# Altium schematic sheet AT25256A_1.SchDoc
size 420 x 297 mm; Organization: Protel International P/L; PageSetup: Record=PageOptions|CenterHorizontal=True|CenterVertical=True|PrintScale=0.70|XCorrection=1.00|YCorrection=1.00|PrintKind=2|BorderSize=5000000|LeftOffset=0|BottomOffset=0|Orientation=2|PaperLength=1000|PaperWidth=1000|Scale=100|PaperSource=7|PrintQuality=600|MediaType=1|DitherType=10|PaperKind=A4|PrintScaleMode=1; Razrabotal: Балобанов; Proveril: Шартдинов; NachKb: Рекалов; Nkontr: Завалина; Utv: Беккель; DecNum: ЦВИЯ.467239.035 Э3; Naim1: УУ; Naim2: Схема электрическая; Naim3: принципиальная; List: 1; Listov: 1; DecNum2: ЦВИЯ.467239.035 Э3
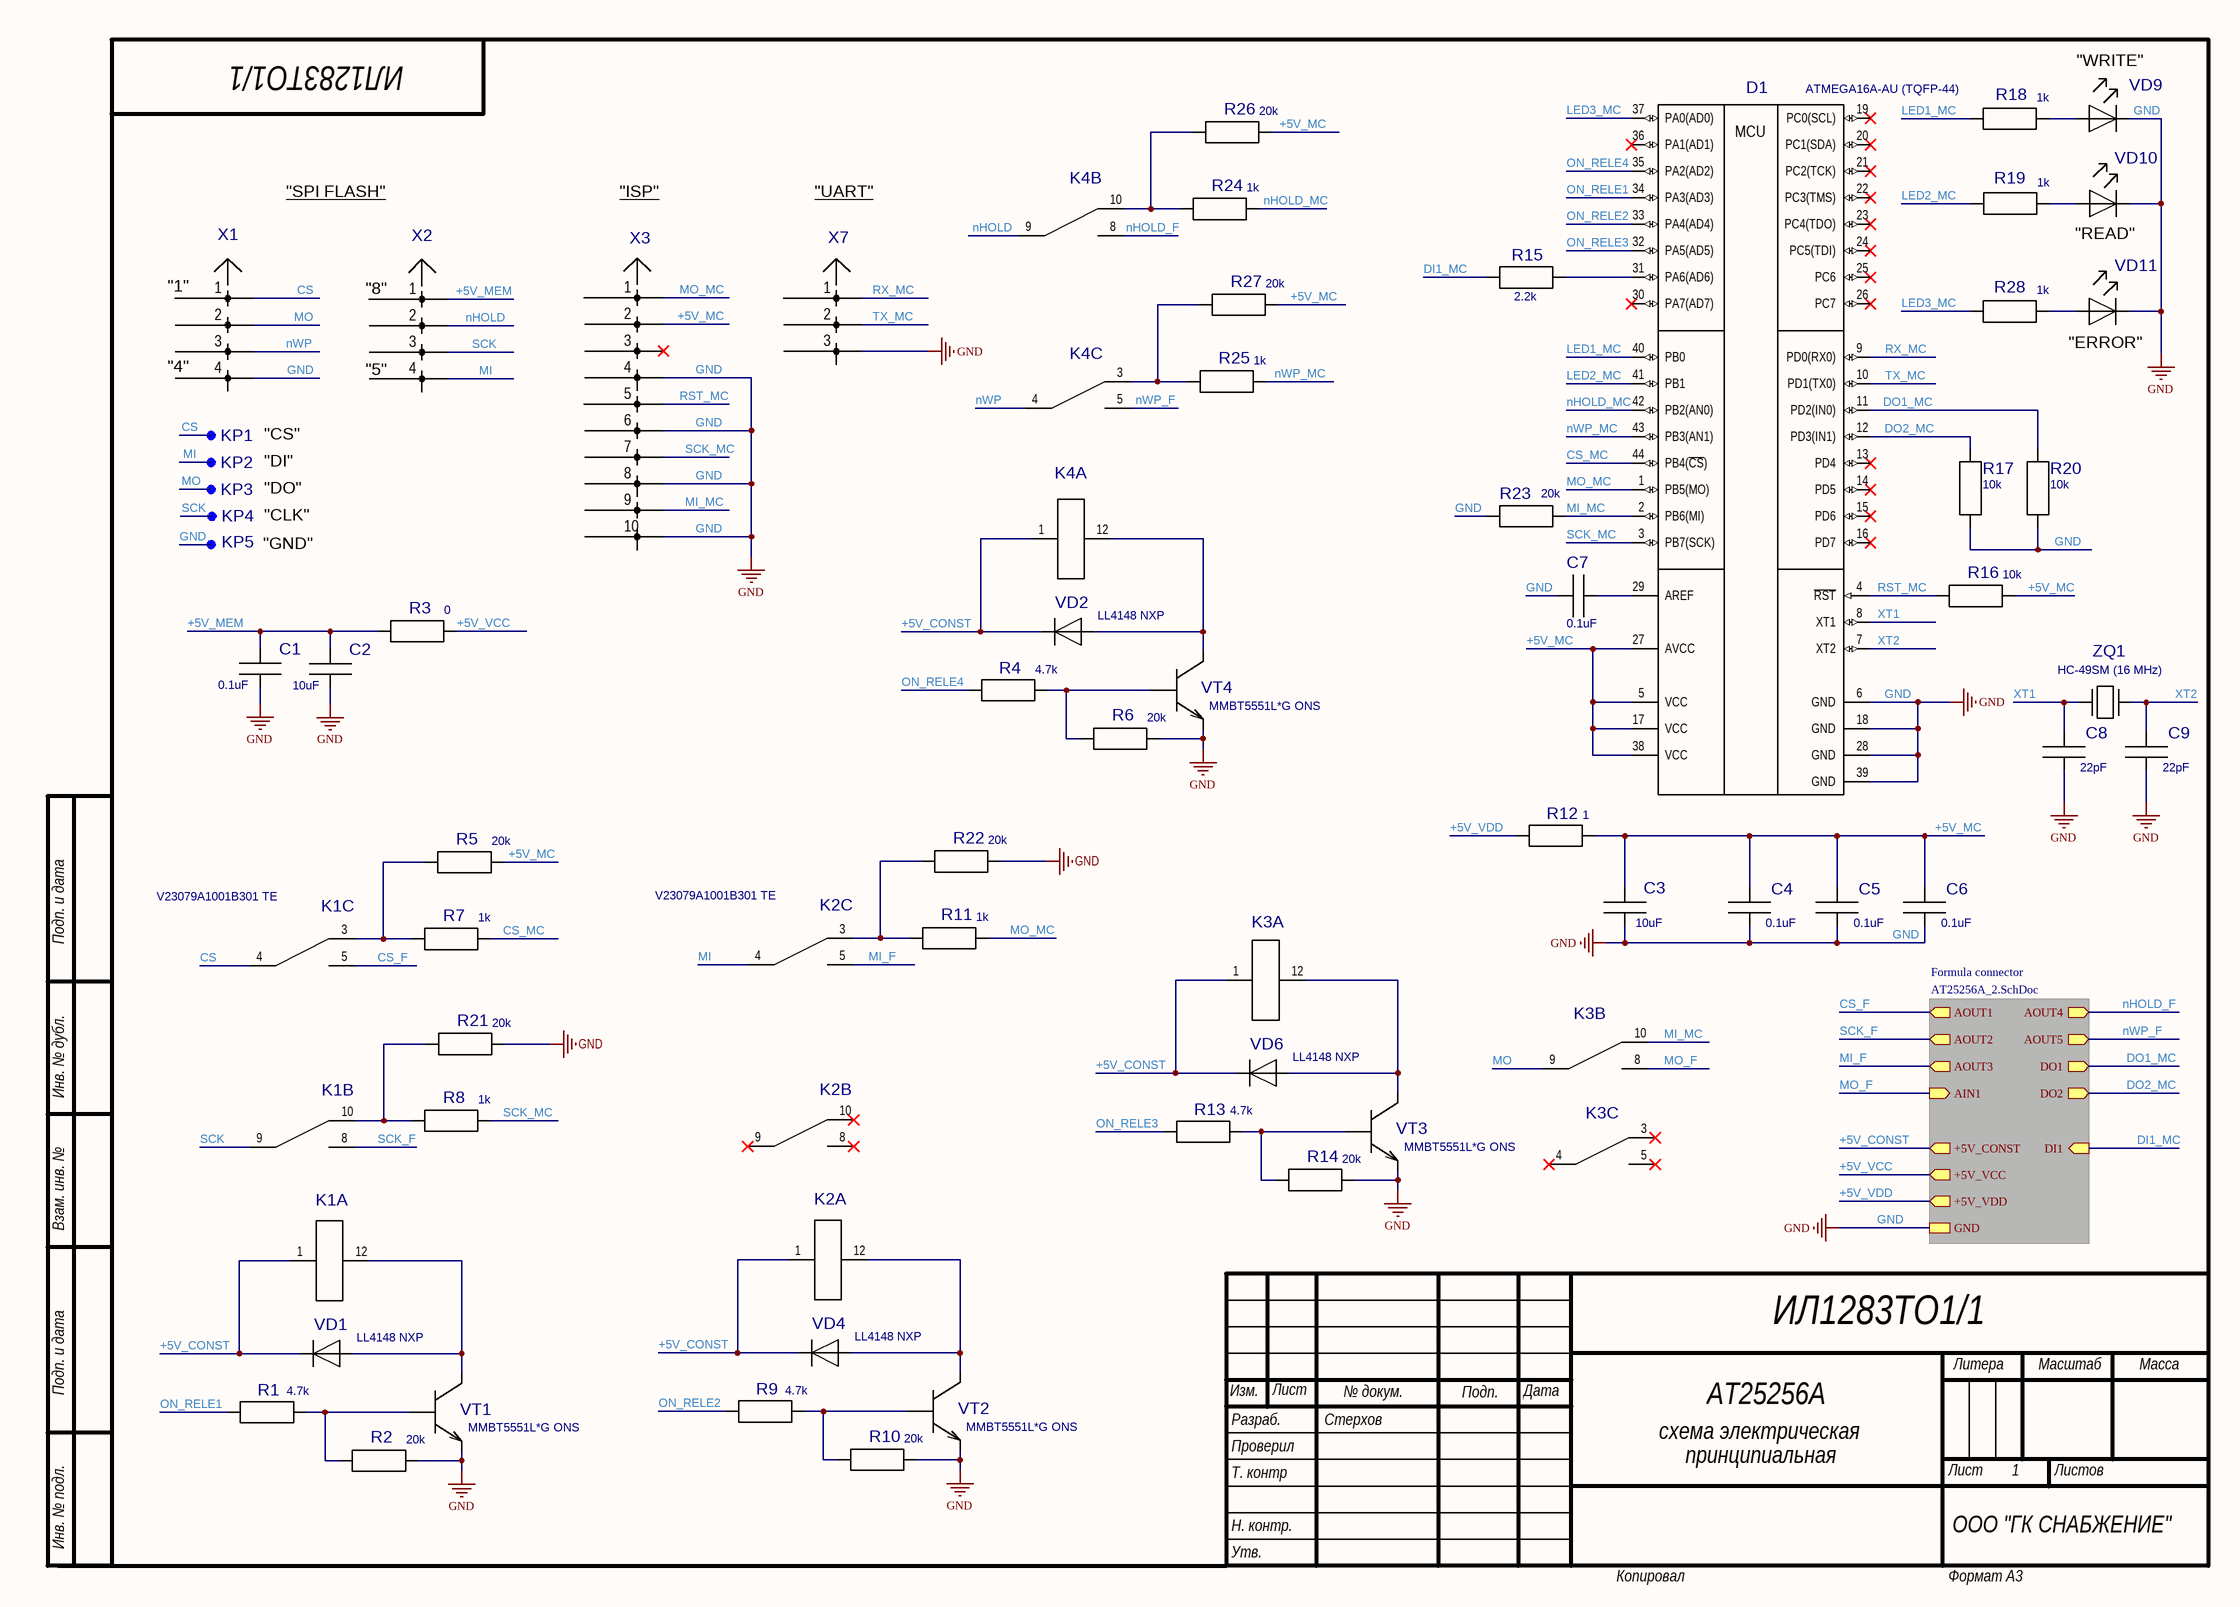
[diagram p0: AT25256A_1.SchDoc]

## Parts
C1  value 0.1uF  [0805 AVX]  (hidden comment: A612 (0805) AVX)
C2  value 10uF  [0805 AVX]  (hidden comment: A612 (0805) AVX)
C3  value 10uF  [0805 AVX]  (hidden comment: A612 (0805) AVX)
C4  value 0.1uF  [0805 AVX]  (hidden comment: A612 (0805) AVX)
C5  value 0.1uF  [0805 AVX]  (hidden comment: A612 (0805) AVX)
C6  value 0.1uF  [0805 AVX]  (hidden comment: A612 (0805) AVX)
C7  value 0.1uF  [0805 AVX]  (hidden comment: A612 (0805) AVX)
C8  value 22pF  [0805 AVX]  (hidden comment: A612 (0805) AVX)
C9  value 22pF  [0805 AVX]  (hidden comment: A612 (0805) AVX)
D1  ATMEGA16A-AU (TQFP-44)  [44-TQFP]
K1  V23079A1001B301 TE  [V23079A1001B301]  (value not drawn)  (parts A,B,C of 3)
K2  V23079A1001B301 TE  [V23079A1001B301]  (value not drawn)  (parts A,B,C of 3)
K3  V23079A1001B301 TE  [V23079A1001B301]  (value not drawn)  (parts A,B,C of 3)
K4  V23079A1001B301 TE  [V23079A1001B301]  (value not drawn)  (parts A,B,C of 3)
KP1  Contplosh2.5x0.8  [Plosh25x08]  (value not drawn)
KP2  Contplosh2.5x0.8  [Plosh25x08]  (value not drawn)
KP3  Contplosh2.5x0.8  [Plosh25x08]  (value not drawn)
KP4  Contplosh2.5x0.8  [Plosh25x08]  (value not drawn)
KP5  Contplosh2.5x0.8  [Plosh25x08]  (value not drawn)
R1  4.7k  [0805]
R2  20k  [0805]
R3  0  [0805]
R4  4.7k  [0805]
R5  20k  [0805]
R6  20k  [0805]
R7  1k  [0805]
R8  1k  [0805]
R9  4.7k  [0805]
R10  20k  [0805]
R11  1k  [0805]
R12  1  [0805]
R13  4.7k  [0805]
R14  20k  [0805]
R15  2.2k  [0805]
R16  10k  [0805]
R17  10k  [0805]
R18  1k  [0805]
R19  1k  [0805]
R20  10k  [0805]
R21  20k  [0805]
R22  20k  [0805]
R23  20k  [0805]
R24  1k  [0805]
R25  1k  [0805]
R26  20k  [0805]
R27  20k  [0805]
R28  1k  [0805]
VD1  LL4148 NXP  [SOD80C]
VD2  LL4148 NXP  [SOD80C]
VD4  LL4148 NXP  [SOD80C]
VD6  LL4148 NXP  [SOD80C]
VD9  LED(0805)  [0805]  (value not drawn)
VD10  LED(0805)  [0805]  (value not drawn)
VD11  LED(0805)  [0805]  (value not drawn)
VT1  MMBT5551L*G ONS  [SOT-23]
VT2  MMBT5551L*G ONS  [SOT-23]
VT3  MMBT5551L*G ONS  [SOT-23]
VT4  MMBT5551L*G ONS  [SOT-23]
X1  PLD4-2,54  [PLD4-2,54]  (value not drawn)
X2  PLD4-2,54  [PLD4-2,54]  (value not drawn)
X3  PLD10-2,54  [PLD10-2,54]  (value not drawn)
X7  PLD3-2,54  [PLD3-2,54]  (value not drawn)
ZQ1  HC-49SM (16 MHz)  [HC-49SM]

## Sub-sheets
Formula connector = AT25256A_2.SchDoc: DO1 (out), DO2 (out), DI1 (in), AOUT2 (out), +5V_VCC (out), +5V_VDD (out), GND, +5V_CONST (out), AOUT3 (out), AIN1 (in), AOUT1 (out), AOUT4 (out), AOUT5 (out)

## Nets
GND: C1.2 C2.2 C3.2 C4.2 C5.2 C6.2 C7.1 C8.2 C9.2 D1.6(GND) D1.18(GND) D1.28(GND) D1.39(GND) KP5.1 R2.2 R6.2 R10.2 R14.2 R17.1 R20.1 R21.2 R22.2 R23.1 VD9.2(K) VD10.2(K) VD11.2(K) VT1.2(E) VT2.2(E) VT3.2(E) VT4.2(E) X1.4 X3.4 X3.6 X3.8 X3.10 X7.3 ; sheet Formula connector/GND
+5V_CONST: K1.1(+) K2.1(+) K3.1(+) K4.1(+) VD1.2(K) VD2.2(K) VD4.2(K) VD6.2(K) ; sheet Formula connector/+5V_CONST
+5V_MC: C3.1 C4.1 C5.1 C6.1 D1.5(VCC) D1.17(VCC) D1.27(AVCC) D1.38(VCC) R5.2 R12.2 R16.2 R26.2 R27.2 X3.2
+5V_MEM: C1.1 C2.1 R3.1 X2.1
+5V_VCC: R3.2 ; sheet Formula connector/+5V_VCC
+5V_VDD: R12.1 ; sheet Formula connector/+5V_VDD
CS: K1.4(sw4) KP1.1 X1.1
CS_F: K1.5(sw6) ; sheet Formula connector/AOUT1
CS_MC: D1.44(PB4(~{CS})) R7.2
DI1_MC: R15.1 ; sheet Formula connector/DI1
DO1_MC: D1.11(PD2(IN0)) R20.2 ; sheet Formula connector/DO1
DO2_MC: D1.12(PD3(IN1)) R17.2 ; sheet Formula connector/DO2
LED1_MC: D1.40(PB0) R18.1
LED2_MC: D1.41(PB1) R19.1
LED3_MC: D1.37(PA0(AD0)) R28.1
MI: K2.4(sw4) KP2.1 X2.4
MI_F: K2.5(sw6) ; sheet Formula connector/AOUT3
MI_MC: D1.2(PB6(MI)) K3.10(sw2) R23.2 X3.9
MO: K3.9(sw1) KP3.1 X1.2
MO_F: K3.8(sw3) ; sheet Formula connector/AIN1
MO_MC: D1.1(PB5(MO)) R11.2 X3.1
nHOLD: K4.9(sw1) X2.2
nHOLD_F: K4.8(sw3) ; sheet Formula connector/AOUT4
nHOLD_MC: D1.42(PB2(AN0)) R24.2
nWP: K4.4(sw4) X1.3
nWP_F: K4.5(sw6) ; sheet Formula connector/AOUT5
nWP_MC: D1.43(PB3(AN1)) R25.2
ON_RELE1: D1.34(PA3(AD3)) R1.1
ON_RELE2: D1.33(PA4(AD4)) R9.1
ON_RELE3: D1.32(PA5(AD5)) R13.1
ON_RELE4: D1.35(PA2(AD2)) R4.1
RST_MC: D1.4(~{RST}) R16.1 X3.5
RX_MC: D1.9(PD0(RX0)) X7.1
SCK: K1.9(sw1) KP4.1 X2.3
SCK_F: K1.8(sw3) ; sheet Formula connector/AOUT2
SCK_MC: D1.3(PB7(SCK)) R8.2 X3.7
TX_MC: D1.10(PD1(TX0)) X7.2
XT1: C8.1 D1.8(XT1) ZQ1.1
XT2: C9.1 D1.7(XT2) ZQ1.2
NetC7_2: C7.2 D1.29(AREF)
NetD1_31: D1.31(PA6(AD6)) R15.2
NetK1_3: K1.3(sw5) R5.1 R7.1
NetK1_10: K1.10(sw2) R8.1 R21.1
NetK1_12: K1.12(-) VD1.1(A) VT1.3(K)
NetK2_3: K2.3(sw5) R11.1 R22.1
NetK2_12: K2.12(-) VD4.1(A) VT2.3(K)
NetK3_12: K3.12(-) VD6.1(A) VT3.3(K)
NetK4_3: K4.3(sw5) R25.1 R27.1
NetK4_10: K4.10(sw2) R24.1 R26.1
NetK4_12: K4.12(-) VD2.1(A) VT4.3(K)
NetR1_2: R1.2 R2.1 VT1.1(B)
NetR4_2: R4.2 R6.1 VT4.1(B)
NetR9_2: R9.2 R10.1 VT2.1(B)
NetR13_2: R13.2 R14.1 VT3.1(B)
NetR18_2: R18.2 VD9.1(A)
NetR19_2: R19.2 VD10.1(A)
NetR28_2: R28.2 VD11.1(A)

Not connected (* = marked no-connect by the designer): D1 13(PD4)* 14(PD5)* 15(PD6)* 16(PD7)* 19(PC0(SCL))* 20(PC1(SDA))* 21(PC2(TCK))* 22(PC3(TMS))* 23(PC4(TDO))* 24(PC5(TDI))* 25(PC6)* 26(PC7)* 30(PA7(AD7))* 36(PA1(AD1))*; K2 8(sw3)* 9(sw1)* 10(sw2)*; K3 3(sw5)* 4(sw4)* 5(sw6)*; X3 3*

## Notes on the sheet
- ИЛ1283ТО1/1
- "WRITE"
- "SPI FLASH"
- "ISP"
- "UART"
- (near VD10) "READ"
- (near X1) "1"
- (near X2) "8"
- (near X1) "4"
- (near X2) "5"
- (near VD11) "ERROR"
- "CS"
- "DI"
- "DO"
- "CLK"
- "GND"
- Подп. и дата
- Инв. № дубл.
- Взам. инв. №
- Изм.
- Лист
- № докум.
- Подп.
- Дата
- AT25256A
- Литера
- Масштаб
- Масса
- Разраб.
- Проверил
- Т. контр
- Стерхов
- схема электрическая
- принципиальная
- 1
- Листов
- Инв. № подл.
- Н. контр.
- ООО "ГК СНАБЖЕНИЕ"
- Утв.
- Копировал
- Формат А3
- (in symbol ATMEGA16A-AU (TQFP-44)) MCU

## Library data of the parts
C1-C9 = A612 (0805) AVX: ComponentHeigt: 1.3; Leadform: SMD; KIND: Конденсатор; ClassName: *; Component Link: *; ComponentWeigt: *; Firme: AVX; Packaging: 0805; NN: *
D1 = ATMEGA16A-AU (TQFP-44): Leadform: по чертежу; Note: Установка по чертежу; Kind: Микросхема; Component Link: www.honeywell.com/radhard; ClassName: *; NN: *
K1-K4 = V23079A1001B301 TE: ComponentHeigt: 5.6; ComponentWeigt: 2; Leadform: SMD; NN: 26100248; KIND: Реле TQ2-SA-12V Panasonic; ClassName: *; Component Link: *; Packaging: SA type
R1-R28 = RC0805 Yageo: ComponentHeigt: 0.6; Firme: Yageo; Leadform: SMD; Kind: Резистор; ClassName: *; ComponentWeigt: *; Component Link: *; Packaging: 0805; NN: *; Value: *
VD1 VD2 VD4 VD6 = LL4148 NXP: ComponentHeigt: 1.6; Leadform: SMD; NN: 24009301; KIND: Диод LL4148 NXP; Component Link: http://www.nxp.com; Packaging: SOD-80C; ClassName: *; Firme: NXP
VD9-VD11 = LED(0805): ComponentHeigt: 0.75; Leadform: в отверстия; Firme: Kingbright; NN: 24003000; KIND: Светодиод L-1154GD Kingbright; Component Link: *; ClassName: *
VT1-VT4 = MMBT5551L*G ONS: ComponentHeigt: 1.1; Leadform: SMD; NN: 24007468; KIND: Транзистор MMBT5551L*G ONS; ClassName: *; ComponentWeigt: *; Firme: ONS; Packaging: SOT-23
X1 X2 = PLD4-2,54: ComponentHeigt: 5.5; Name: Вилка; Specification: Вилка PLD2-2 *; Typ: PLD2-2; ClassName: *; Component Link: *; ComponentWeigt: *; Firme: *; Leadform: *; NN: *; KIND: *
X3 = PLD10-2,54: ComponentHeigt: 5.5; Name: Вилка; Specification: Вилка PLD2-2 *; Typ: PLD2-2; ClassName: *; Component Link: *; ComponentWeigt: *; Firme: *; Leadform: *; NN: *; KIND: *
X7 = PLD3-2,54: ComponentHeigt: 5.5; Name: Вилка; Specification: Вилка PLD2-2 *; Typ: PLD2-2; ClassName: *; Component Link: *; ComponentWeigt: *; Firme: *; Leadform: *; NN: *; KIND: *
ZQ1 = HC-49SM
KP1-KP5 = Contplosh2.5x0.8: Value: *